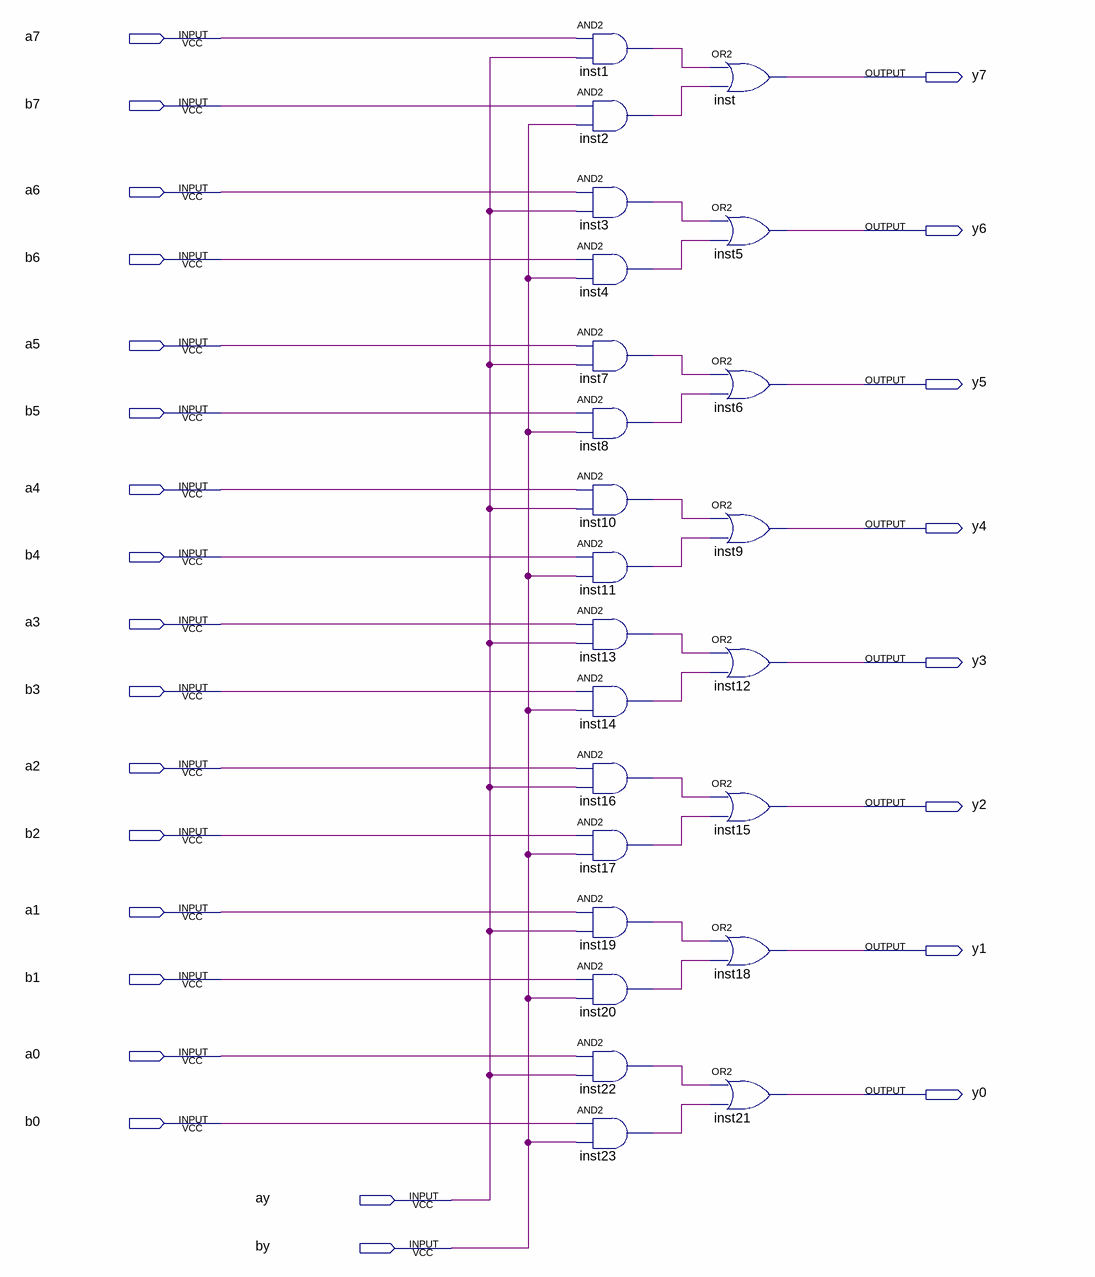
[diagram p0: schematic sheet]
// Quartus schematic selection.bdf as structural Verilog: 24 symbols, 26 pins
module selection (
  input  a7,
  input  b7,
  input  a6,
  input  b6,
  input  a5,
  input  b5,
  input  a4,
  input  b4,
  input  a3,
  input  b3,
  input  a2,
  input  b2,
  input  a1,
  input  b1,
  input  a0,
  input  b0,
  input  ay,
  input  by,
  output y7,
  output y6,
  output y5,
  output y4,
  output y3,
  output y2,
  output y1,
  output y0
);

  wire inst1_out, inst2_out, inst3_out, inst4_out, inst7_out, inst8_out, inst10_out, inst11_out, inst13_out,
       inst14_out, inst16_out, inst17_out, inst19_out, inst20_out, inst22_out, inst23_out;

  and inst1 (inst1_out, a7, ay);
  and inst2 (inst2_out, b7, by);
  and inst3 (inst3_out, a6, ay);
  and inst4 (inst4_out, b6, by);
  and inst7 (inst7_out, a5, ay);
  and inst8 (inst8_out, b5, by);
  and inst10 (inst10_out, a4, ay);
  and inst11 (inst11_out, b4, by);
  and inst13 (inst13_out, a3, ay);
  and inst14 (inst14_out, b3, by);
  and inst16 (inst16_out, a2, ay);
  and inst17 (inst17_out, b2, by);
  and inst19 (inst19_out, a1, ay);
  and inst20 (inst20_out, b1, by);
  and inst22 (inst22_out, a0, ay);
  and inst23 (inst23_out, b0, by);
  or inst (y7, inst1_out, inst2_out);
  or inst5 (y6, inst3_out, inst4_out);
  or inst6 (y5, inst7_out, inst8_out);
  or inst9 (y4, inst10_out, inst11_out);
  or inst12 (y3, inst13_out, inst14_out);
  or inst15 (y2, inst16_out, inst17_out);
  or inst18 (y1, inst19_out, inst20_out);
  or inst21 (y0, inst22_out, inst23_out);
endmodule
